# Altium project Membrane_Flex_Cable (80-Pin).PrjPcb
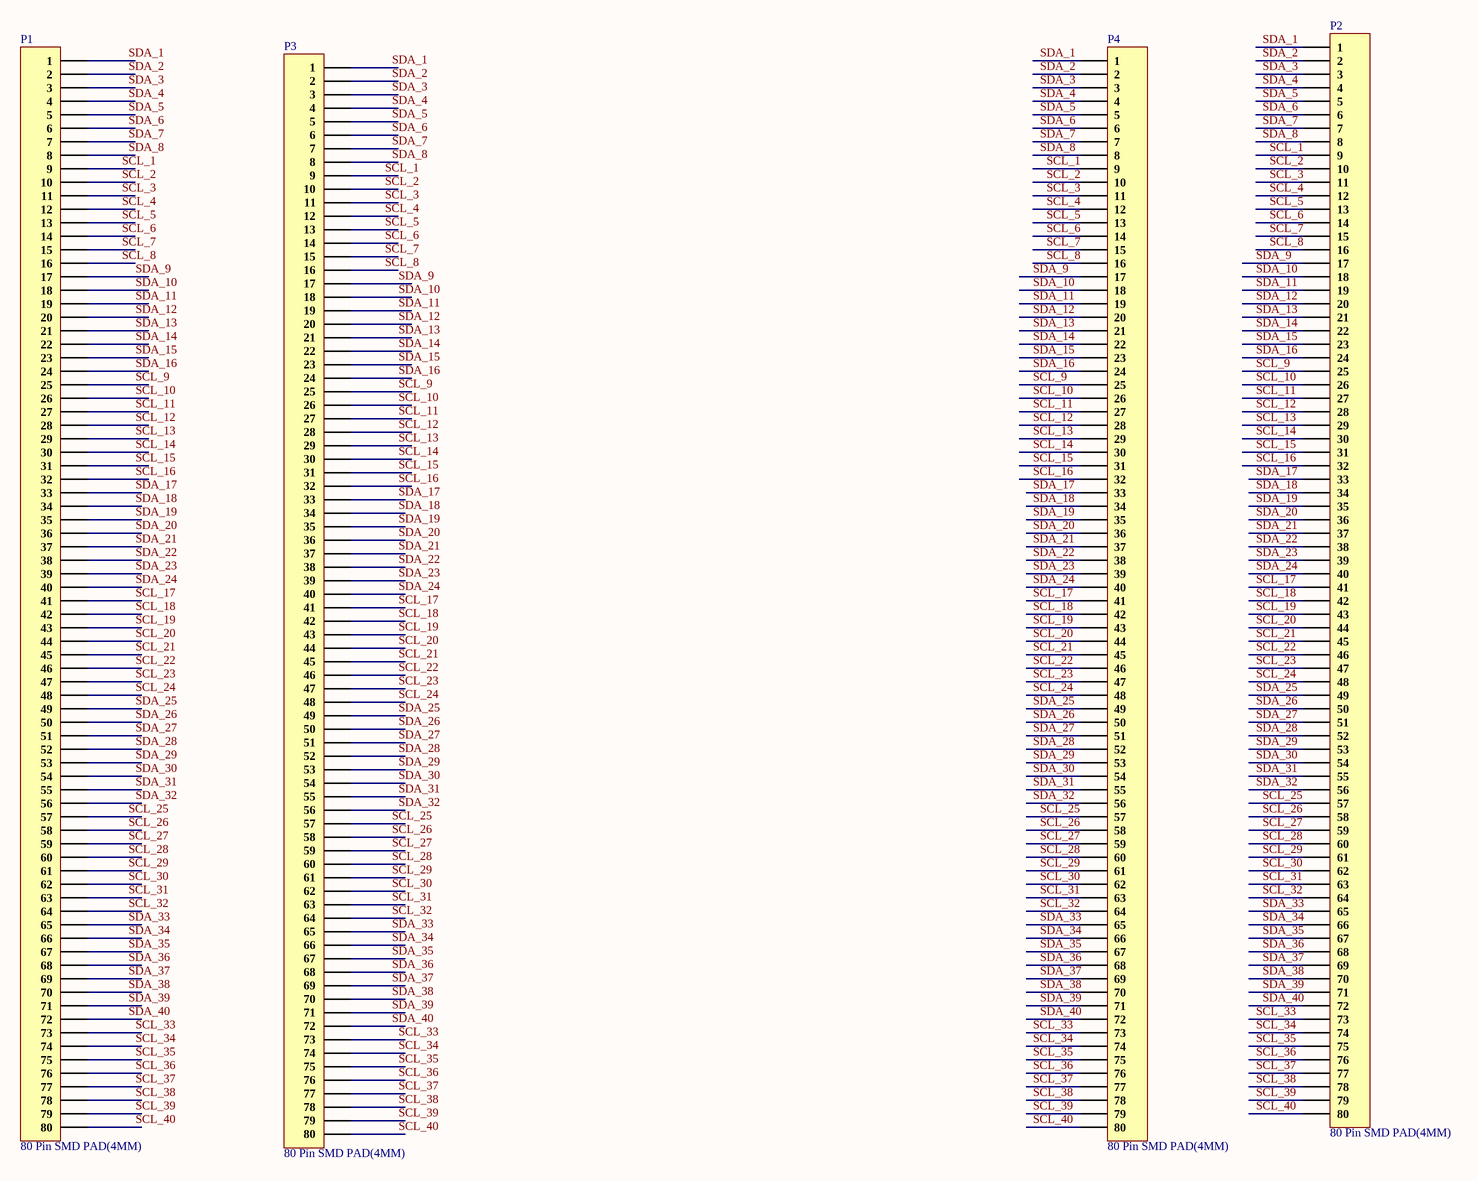
[diagram p0: Sheet1.SchDoc]
1 sheet, 4 parts. Net scope: global (net labels, ports and power ports of the same name join across sheets).
Board file: PCB_Flex_80.PcbDoc

## Sheet Sheet1.SchDoc
size A3; SheetNumber: 1; SheetTotal: 1

### Parts
P1  80 Pin SMD PAD(4MM)  [80 Pin SMD PAD(4mm)]
P2  80 Pin SMD PAD(4MM)  [80 Pin SMD PAD(4mm)]
P3  80 Pin SMD PAD(4MM)  [80 Pin SMD PAD(4mm)]
P4  80 Pin SMD PAD(4MM)  [80 Pin SMD PAD(4mm)]

### Nets
SCL_1: P1.9 P2.9 P3.9 P4.9
SCL_2: P1.10 P2.10 P3.10 P4.10
SCL_3: P1.11 P2.11 P3.11 P4.11
SCL_4: P1.12 P2.12 P3.12 P4.12
SCL_5: P1.13 P2.13 P3.13 P4.13
SCL_6: P1.14 P2.14 P3.14 P4.14
SCL_7: P1.15 P2.15 P3.15 P4.15
SCL_8: P1.16 P2.16 P3.16 P4.16
SCL_9: P1.25 P2.25 P3.25 P4.25
SCL_10: P1.26 P2.26 P3.26 P4.26
SCL_11: P1.27 P2.27 P3.27 P4.27
SCL_12: P1.28 P2.28 P3.28 P4.28
SCL_13: P1.29 P2.29 P3.29 P4.29
SCL_14: P1.30 P2.30 P3.30 P4.30
SCL_15: P1.31 P2.31 P3.31 P4.31
SCL_16: P1.32 P2.32 P3.32 P4.32
SCL_17: P1.41 P2.41 P3.41 P4.41
SCL_18: P1.42 P2.42 P3.42 P4.42
SCL_19: P1.43 P2.43 P3.43 P4.43
SCL_20: P1.44 P2.44 P3.44 P4.44
SCL_21: P1.45 P2.45 P3.45 P4.45
SCL_22: P1.46 P2.46 P3.46 P4.46
SCL_23: P1.47 P2.47 P3.47 P4.47
SCL_24: P1.48 P2.48 P3.48 P4.48
SCL_25: P1.57 P2.57 P3.57 P4.57
SCL_26: P1.58 P2.58 P3.58 P4.58
SCL_27: P1.59 P2.59 P3.59 P4.59
SCL_28: P1.60 P2.60 P3.60 P4.60
SCL_29: P1.61 P2.61 P3.61 P4.61
SCL_30: P1.62 P2.62 P3.62 P4.62
SCL_31: P1.63 P2.63 P3.63 P4.63
SCL_32: P1.64 P2.64 P3.64 P4.64
SCL_33: P1.73 P2.73 P3.73 P4.73
SCL_34: P1.74 P2.74 P3.74 P4.74
SCL_35: P1.75 P2.75 P3.75 P4.75
SCL_36: P1.76 P2.76 P3.76 P4.76
SCL_37: P1.77 P2.77 P3.77 P4.77
SCL_38: P1.78 P2.78 P3.78 P4.78
SCL_39: P1.79 P2.79 P3.79 P4.79
SCL_40: P1.80 P2.80 P3.80 P4.80
SDA_1: P1.1 P2.1 P3.1 P4.1
SDA_2: P1.2 P2.2 P3.2 P4.2
SDA_3: P1.3 P2.3 P3.3 P4.3
SDA_4: P1.4 P2.4 P3.4 P4.4
SDA_5: P1.5 P2.5 P3.5 P4.5
SDA_6: P1.6 P2.6 P3.6 P4.6
SDA_7: P1.7 P2.7 P3.7 P4.7
SDA_8: P1.8 P2.8 P3.8 P4.8
SDA_9: P1.17 P2.17 P3.17 P4.17
SDA_10: P1.18 P2.18 P3.18 P4.18
SDA_11: P1.19 P2.19 P3.19 P4.19
SDA_12: P1.20 P2.20 P3.20 P4.20
SDA_13: P1.21 P2.21 P3.21 P4.21
SDA_14: P1.22 P2.22 P3.22 P4.22
SDA_15: P1.23 P2.23 P3.23 P4.23
SDA_16: P1.24 P2.24 P3.24 P4.24
SDA_17: P1.33 P2.33 P3.33 P4.33
SDA_18: P1.34 P2.34 P3.34 P4.34
SDA_19: P1.35 P2.35 P3.35 P4.35
SDA_20: P1.36 P2.36 P3.36 P4.36
SDA_21: P1.37 P2.37 P3.37 P4.37
SDA_22: P1.38 P2.38 P3.38 P4.38
SDA_23: P1.39 P2.39 P3.39 P4.39
SDA_24: P1.40 P2.40 P3.40 P4.40
SDA_25: P1.49 P2.49 P3.49 P4.49
SDA_26: P1.50 P2.50 P3.50 P4.50
SDA_27: P1.51 P2.51 P3.51 P4.51
SDA_28: P1.52 P2.52 P3.52 P4.52
SDA_29: P1.53 P2.53 P3.53 P4.53
SDA_30: P1.54 P2.54 P3.54 P4.54
SDA_31: P1.55 P2.55 P3.55 P4.55
SDA_32: P1.56 P2.56 P3.56 P4.56
SDA_33: P1.65 P2.65 P3.65 P4.65
SDA_34: P1.66 P2.66 P3.66 P4.66
SDA_35: P1.67 P2.67 P3.67 P4.67
SDA_36: P1.68 P2.68 P3.68 P4.68
SDA_37: P1.69 P2.69 P3.69 P4.69
SDA_38: P1.70 P2.70 P3.70 P4.70
SDA_39: P1.71 P2.71 P3.71 P4.71
SDA_40: P1.72 P2.72 P3.72 P4.72

### Library data of the parts
P1-P4 = 80 Pin SMD PAD(4MM): Ribbon Wire Connecting PADs, Length 2.6mm.